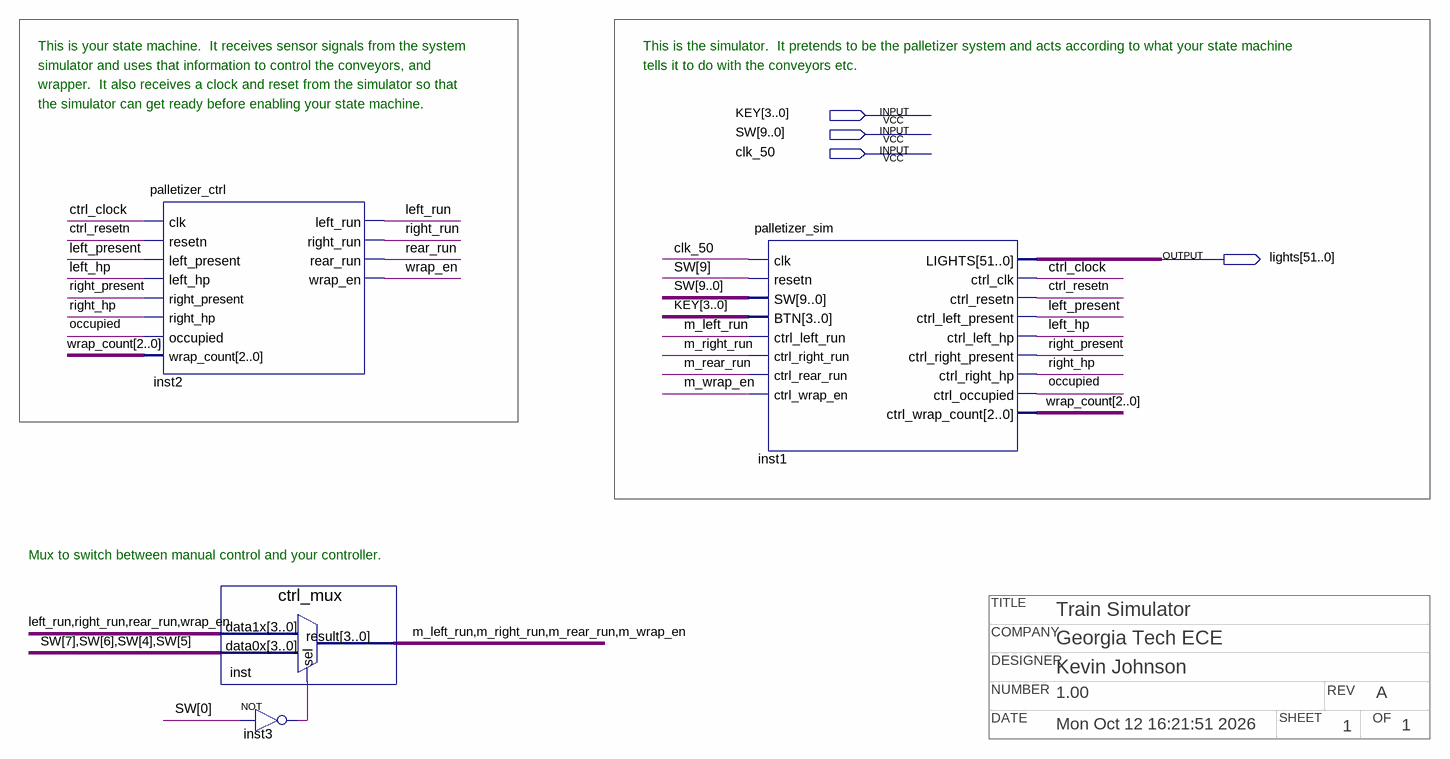
[diagram p0: schematic sheet]
// Quartus schematic PalletizerTop.bdf as structural Verilog: 4 symbols, 4 pins
// Title block: COMPANY: Georgia Tech ECE; DATE: Mon Oct 12 16:21:51 2026; DESIGNER: Kevin Johnson; NUMBER: 1.00; OF: 1; REV: A; SHEET: 1; TITLE: Train Simulator
module PalletizerTop (
  input  [3:0] KEY,
  input  [9:0] SW,
  input  clk_50,
  output [51:0] lights
);

  wire ctrl_clock, ctrl_resetn, inst3_out, left_hp, left_present, left_run, m_left_run, m_rear_run,
       m_right_run, m_wrap_en, occupied, rear_run, right_hp, right_present, right_run, wrap_en;
  wire [2:0] wrap_count;

  palletizer_ctrl inst2 (
    .clk(ctrl_clock), .resetn(ctrl_resetn), .left_present(left_present), .left_hp(left_hp),
    .right_present(right_present), .right_hp(right_hp), .occupied(occupied), .wrap_count(wrap_count),
    .left_run(left_run), .right_run(right_run), .rear_run(rear_run), .wrap_en(wrap_en));
  ctrl_mux inst (
    .data1x({left_run, right_run, rear_run, wrap_en}), .data0x({SW[7:6], SW[4], SW[5]}), .sel(inst3_out),
    .result({m_left_run, m_right_run, m_rear_run, m_wrap_en}));
  not inst3 (inst3_out, SW[0]);
  palletizer_sim inst1 (
    .clk(clk_50), .resetn(SW[9]), .SW(SW), .BTN(KEY), .ctrl_left_run(m_left_run),
    .ctrl_right_run(m_right_run), .ctrl_rear_run(m_rear_run), .ctrl_wrap_en(m_wrap_en), .LIGHTS(lights),
    .ctrl_clk(ctrl_clock), .ctrl_resetn(ctrl_resetn), .ctrl_left_present(left_present),
    .ctrl_left_hp(left_hp), .ctrl_right_present(right_present), .ctrl_right_hp(right_hp),
    .ctrl_occupied(occupied), .ctrl_wrap_count(wrap_count));

  // Notes on the sheet:
  //   This is your state machine.  It receives sensor signals from the system
  //   This is the simulator.  It pretends to be the palletizer system and acts according to what your state machine
  //   simulator and uses that information to control the conveyors, and
  //   tells it to do with the conveyors etc.
  //   wrapper.  It also receives a clock and reset from the simulator so that
  //   the simulator can get ready before enabling your state machine.
  //   Mux to switch between manual control and your controller.
endmodule
